# Altium project ESP32_C3_TempHumidity_Monitor.PrjPcb
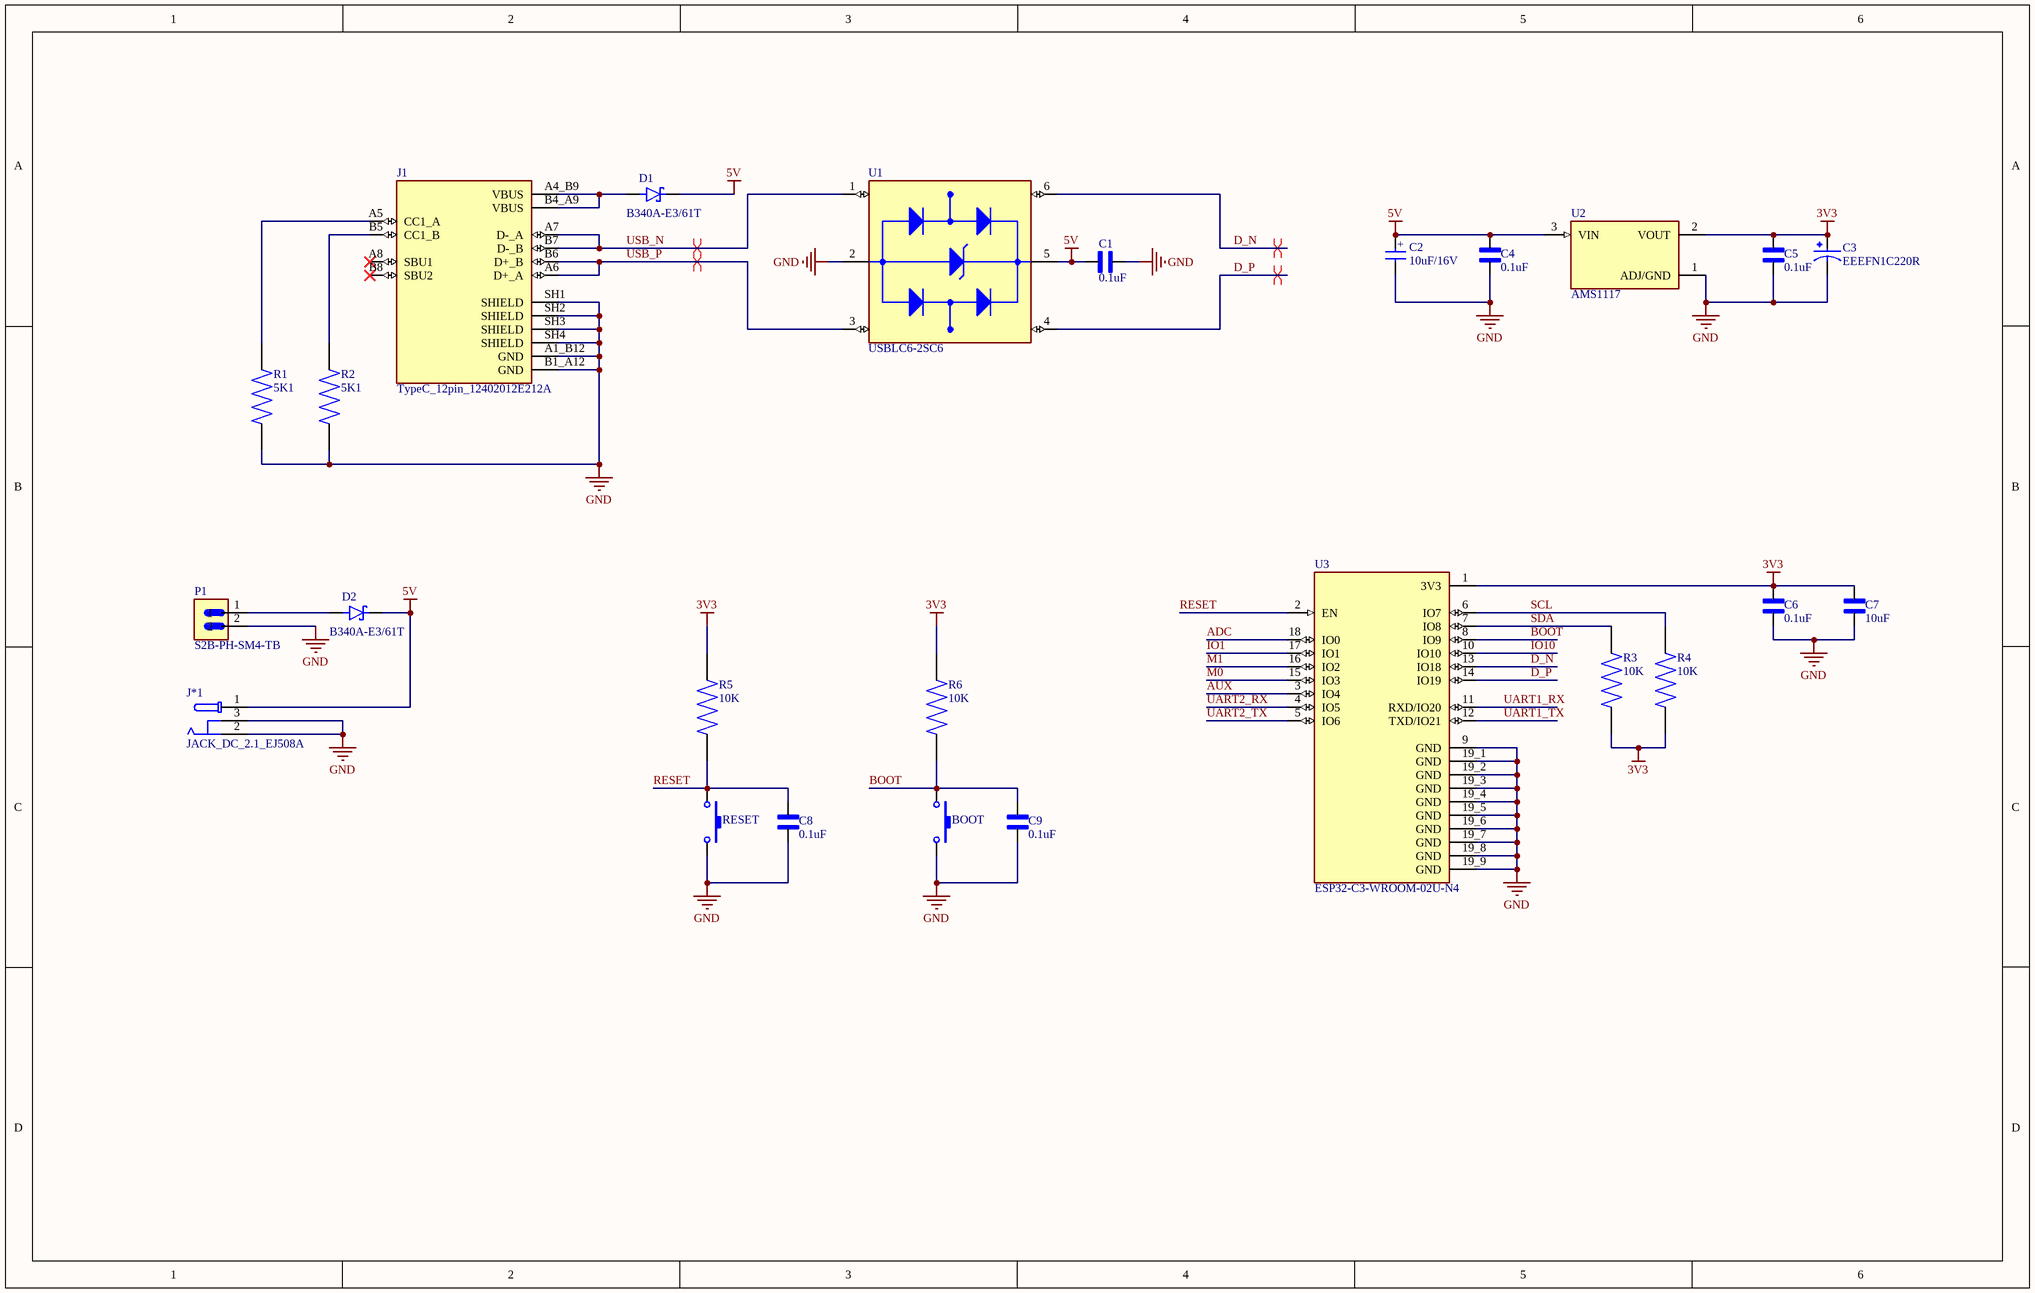
[diagram p0: main.SchDoc]
3 sheets, 50 parts. Net scope: global (net labels, ports and power ports of the same name join across sheets).
Board file: PCB_esp32_c3.PcbDoc
Sheets:
  main.SchDoc
  LoRa.SchDoc
  connect.SchDoc

## Sheet main.SchDoc
size 381 x 241 mm; SheetNumber: 1; SheetTotal: 3

### Parts
BOOT  Nut Nhan 2 Chan SMD 3x6x2.5  [PCBComponent_1]  (value not drawn)
C1  0.1uF  [CAPC1608X94N]
C2  10uF/16V  [WCAP-AS5H_4X5.5(DXL)]
C3  EEEFN1C220R  [CAP_EEEFN1C220R]
C4  0.1uF  [CAPC1608X94N]
C5  0.1uF  [CAPC1608X94N]
C6  0.1uF  [CAPC1608X94N]
C7  10uF  [CAPC1608X94N]
C8  0.1uF  [CAPC1005X61N]
C9  0.1uF  [CAPC1005X61N]
D1  B340A-E3/61T  [DIOM5126X229N]
D2  B340A-E3/61T  [DIOM5126X229N]
J1  TypeC_12pin_12402012E212A  [TypeC_12pin_12402012E212A]
J*1  JACK_DC_2.1_EJ508A  [MPD_EJ508A]
P1  S2B-PH-SM4-TB  [JST_S2B-PH-SM4-TB]
R1  5K1  [RES_ERJU02F5102X]
R2  5K1  [RES_ERJU02F5102X]
R3  10K  [RES_ERJU02F5102X]
R4  10K  [RES_ERJU02F5102X]
R5  10K  [RES_ERJU02F5102X]
R6  10K  [RES_ERJU02F5102X]
RESET  Nut Nhan 2 Chan SMD 3x6x2.5  [PCBComponent_1]  (value not drawn)
U1  USBLC6-2SC6  [USBLC6-2SC6]
U2  AMS1117  [SOT229P700X180-4N]
U3  ESP32-C3-WROOM-02U-N4  [XCVR_ESP32-C3-WROOM-02U-N4]

### Nets
3V3: C3.1 C5.2 C6.2 C7.2 R3.1 R4.1 R5.1 R6.1 U2.2(VOUT) U3.1(3V3)
5V: C1.2 C2.1(POS) C4.2 D1.C D2.C J*1.1 U1.5(VBUS) U2.3(VIN)
GND: BOOT.2 C1.1 C2.2(NEG) C3.2 C4.1 C5.1 C6.1 C7.1 C8.1 C9.1 J1.A1_B12(GND) J1.B1_A12(GND) J1.SH1(SHIELD) J1.SH2(SHIELD) J1.SH3(SHIELD) J1.SH4(SHIELD) J*1.2 J*1.3 P1.2 R1.1 R2.1 RESET.2 U1.2(GND) U2.1(ADJ/GND) U3.9(GND) U3.19_1(GND) U3.19_2(GND) U3.19_3(GND) U3.19_4(GND) U3.19_5(GND) U3.19_6(GND) U3.19_7(GND) U3.19_8(GND) U3.19_9(GND)
ADC: U3.18(IO0)
AUX: U3.3(IO4)
BOOT: BOOT.1 C9.2 R6.2 U3.8(IO9)
D_N: U1.6(I/O1_OUT) U3.13(IO18)
D_P: U1.4(I/O2_OUT) U3.14(IO19)
IO1: U3.17(IO1)
IO10: U3.10(IO10)
M0: U3.15(IO3)
M1: U3.16(IO2)
RESET: C8.2 R5.2 RESET.1 U3.2(EN)
SCL: R4.2 U3.6(IO7)
SDA: R3.2 U3.7(IO8)
UART1_RX: U3.11(RXD/IO20)
UART1_TX: U3.12(TXD/IO21)
UART2_RX: U3.4(IO5)
UART2_TX: U3.5(IO6)
USB_N: J1.A7(D-_A) J1.B7(D-_B) U1.1(I/O1_IN)
USB_P: J1.A6(D+_A) J1.B6(D+_B) U1.3(I/O2_IN)
NetD1_A: D1.A J1.A4_B9(VBUS) J1.B4_A9(VBUS)
NetD2_A: D2.A P1.1
NetJ1_A5: J1.A5(CC1_A) R1.2
NetJ1_B5: J1.B5(CC1_B) R2.2

Not connected (* = marked no-connect by the designer): J1 A8(SBU1)* B8(SBU2)*

### Layout directives
differential pair: D_N, D_P, USB_N, USB_P

### Notes on the sheet
- (in symbol CAP_10uF_25V_WCAP-AS5H_4X5.5) +

### Library data of the parts
BOOT RESET = Nut Nhan 2 Chan SMD 3x6x2.5: Ma_Hang: MH001036; Ten: Nút Nhấn 2 Chân 3x6x2.5MM SMD
C1 C4-C7 = cap_0603_VJ0603D3R9DXCAP: cap 0603 (1608 Metric); MF: Vishay Vitramon; SnapEDA_Link: https://www.snapeda.com/parts/VJ0603D3R9DXCAP/Vishay/view-part/?ref=snap; Package: 1608 Vishay Vitramon; Value: *; MP: VJ0603D3R9DXCAP; Check_prices: https://www.snapeda.com/parts/VJ0603D3R9DXCAP/Vishay/view-part/?ref=eda
C2 = CAP_10uF_25V_WCAP-AS5H_4X5.5: CAP ALUM 10UF 20% 25V SMD; MF: WÃ¼rth Elektronik; MP: 865230440002; SnapEDA_Link: https://www.snapeda.com/parts/865230440002/W%25C3%25BCrth+Elektronik+Midcom/view-part/?ref=snap; Package: Radial WÃ¼rth Elektronik; Value: *; Check_prices: https://www.snapeda.com/parts/865230440002/W%25C3%25BCrth+Elektronik+Midcom/view-part/?ref=eda
C3 = EEEFN1C220R: CAP ALUM 22UF 20% 16V SMD; MF: Panasonic Electronic Components; MP: EEE-FN1C220R; Package: RADIAL-2 Panasonic; Value: *; Price: None; Check_prices: https://www.snapeda.com/parts/EEE-FN1C220R/Panasonic/view-part/6178704/?ref=eda; Purchase-URL: https://pricing.snapeda.com/search/part/EEE-FN1C220R/?ref=eda; Availability: In Stock; SnapEDA_Link: https://www.snapeda.com/parts/EEE-FN1C220R/Panasonic/view-part/6178704/?ref=snap
C8 C9 = cap_0402_VJ0402D100MXCAP: cap 0402; MF: Vishay Vitramon; SnapEDA_Link: https://www.snapeda.com/parts/VJ0402D100MXCAP/Vishay/view-part/?ref=snap; Package: 1005 Vishay Vitramon; Value: *; MP: VJ0402D100MXCAP; Check_prices: https://www.snapeda.com/parts/VJ0402D100MXCAP/Vishay/view-part/?ref=eda
D1 D2 = B340A-E3/61T: Diode Schottky 40 V 3A Surface Mount DO-214AC (SMA); MF: Vishay Semiconductor; SnapEDA_Link: https://www.snapeda.com/parts/B340A-E3/61T/Vishay/view-part/?ref=snap; Package: DO-214 Vishay Semiconductor; Value: *; MP: B340A-E3/61T; Check_prices: https://www.snapeda.com/parts/B340A-E3/61T/Vishay/view-part/?ref=eda
J1 = TypeC_12pin_12402012E212A: USB2.0, Type C, Top mount, CH 1.68mm, Dual Row SMT; MF: Amphenol ICC (Commercial Products); MP: 12402012E212A; Price: None; Package: None; Availability: In Stock; SnapEDA_Link: https://www.snapeda.com/parts/12402012E212A/Amphenol/view-part/?ref=snap; Value: *; Check_prices: https://www.snapeda.com/parts/12402012E212A/Amphenol/view-part/?ref=eda; Purchase-URL: https://pricing.snapeda.com/search/part/12402012E212A/?ref=eda
J*1 = JACK_DC_2.1_EJ508A: Power Barrel Connector Jack 2.10mm ID _0.083_, 5.50mm OD _0.217_ Through Hole, Right Angle / EJ508A; MF: MPD; Package: Non-Standard MPD; Value: *; SnapEDA_Link: https://www.snapeda.com/parts/EJ508A/MPD%20%28Memory%20Protection%20Devices%29/view-part/474399/?ref=snap; Price: None; MP: EJ508A; Availability: Unavailable
P1 = S2B-PH-SM4-TB: Connector Header Surface Mount, Right Angle 2 position 0.079 (2.00mm); MF: JST Sales; SnapEDA_Link: https://www.snapeda.com/parts/S2B-PH-SM4-TB/JST/view-part/?ref=snap; Package: None; Value: *; MP: S2B-PH-SM4-TB; Check_prices: https://www.snapeda.com/parts/S2B-PH-SM4-TB/JST/view-part/?ref=eda
R1-R6 = res_0402_ERJU02F5102X: Availability: Unavailable; MP: ERJU02F5102X; Price: None; Package: None; Value: *
U1 = USBLC6-2SC6: 17V Clamp 5A (8/20Âµs) Ipp Tvs Diode Surface Mount SOT-23-6; MF: STMicroelectronics; Value: *; SnapEDA_Link: https://www.snapeda.com/parts/USBLC6-2SC6/STMicroelectronics/view-part/?ref=snap; Check_prices: https://www.snapeda.com/parts/USBLC6-2SC6/STMicroelectronics/view-part/?ref=eda; Purchase-URL: https://pricing.snapeda.com/search/part/USBLC6-2SC6/?ref=eda; Price: None; Availability: In Stock; Package: SOT-23-6 STMicroelectronics; MP: USBLC6-2SC6
U2 = AMS1117: 1A LOW DROPOUT VOLTAGE REGULATOR SOT-223; MF: Advanced Monolithic Systems; SnapEDA_Link: https://www.snapeda.com/parts/AMS1117/Advanced+Monolithic+Systems/view-part/?ref=snap; Package: SOT-223 Seeed Technology; Value: *; MP: AMS1117; Check_prices: https://www.snapeda.com/parts/AMS1117/Advanced+Monolithic+Systems/view-part/?ref=eda
U3 = ESP32-C3-WROOM-02U-N4: Bluetooth, WiFi 802.11b/g/n, Bluetooth v5.0 Transceiver Module 2.4GHz Antenna Not Included, U.FL Surface Mount; MF: Espressif Systems; SnapEDA_Link: https://www.snapeda.com/parts/ESP32-C3-WROOM-02U-N4/Espressif+Systems/view-part/?ref=snap; Package: SMD-19 Espressif Systems; Value: *; MP: ESP32-C3-WROOM-02U-N4; Check_prices: https://www.snapeda.com/parts/ESP32-C3-WROOM-02U-N4/Espressif+Systems/view-part/?ref=eda

## Sheet LoRa.SchDoc
size A; SheetNumber: 2; SheetTotal: 3
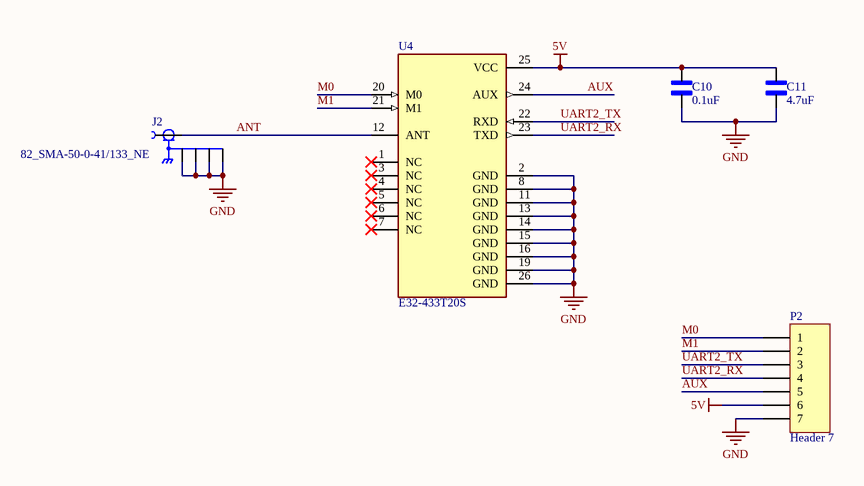
[diagram p1: LoRa.SchDoc]

### Parts
C10  0.1uF  [CAPC1005X61N]
C11  4.7uF  [CAPC1005X61N]
J2  82_SMA-50-0-41/133_NE  [HUBER+SUHNER_82_SMA-50-0-41/133_NE]
P2  Header 7  [HDR1X7]
U4  E32-433T20S  [MODULE_E32-433T20S]

### Nets
5V: C10.2 C11.2 P2.6 U4.25(VCC)
GND: C10.1 C11.1 J2.G1 J2.G2 J2.G3 J2.G4 P2.7 U4.2(GND) U4.8(GND) U4.11(GND) U4.13(GND) U4.14(GND) U4.15(GND) U4.16(GND) U4.19(GND) U4.26(GND)
ANT: J2.1 U4.12(ANT)
AUX: P2.5 U4.24(AUX)
M0: P2.1 U4.20(M0)
M1: P2.2 U4.21(M1)
UART2_RX: P2.4 U4.23(TXD)
UART2_TX: P2.3 U4.22(RXD)

Not connected (* = marked no-connect by the designer): U4 1(NC)* 3(NC)* 4(NC)* 5(NC)* 6(NC)* 7(NC)*

### Library data of the parts
C10 C11 = cap_0402_VJ0402D100MXCAP: cap 0402; MF: Vishay Vitramon; SnapEDA_Link: https://www.snapeda.com/parts/VJ0402D100MXCAP/Vishay/view-part/?ref=snap; Package: 1005 Vishay Vitramon; Value: *; MP: VJ0402D100MXCAP; Check_prices: https://www.snapeda.com/parts/VJ0402D100MXCAP/Vishay/view-part/?ref=eda
J2 = 82_SMA-50-0-41/133_NE: RF Connectors / Coaxial Connectors, Straight Pcb Jack | HUBER+SUHNER 82_SMA-50-0-41/133_NE; SnapEDA_Link: https://www.snapeda.com/parts/82_SMA-50-0-41/133_NE/Huber%252BSuhner/view-part/?ref=snap; Package: None; Value: *; MF: HUBER+SUHNER; MP: 82_SMA-50-0-41/133_NE; Check_prices: https://www.snapeda.com/parts/82_SMA-50-0-41/133_NE/Huber%252BSuhner/view-part/?ref=eda
P2 = Header 7: Header, 7-Pin; LatestRevisionDate: 17-Jul-2002; LatestRevisionNote: Re-released for DXP Platform.; Publisher: Altium Limited
U4 = E32-433T20S: Wireless serial port module (UART); MF: EBYTE; Check_prices: https://www.snapeda.com/parts/E32-433T20S/EBYTE/view-part/?ref=eda; Package: Package; MP: E32-433T20S; Value: *; SnapEDA_Link: https://www.snapeda.com/parts/E32-433T20S/EBYTE/view-part/?ref=snap; Price: None; Availability: Not in stock

## Sheet connect.SchDoc
size B; SheetNumber: 3; SheetTotal: 3
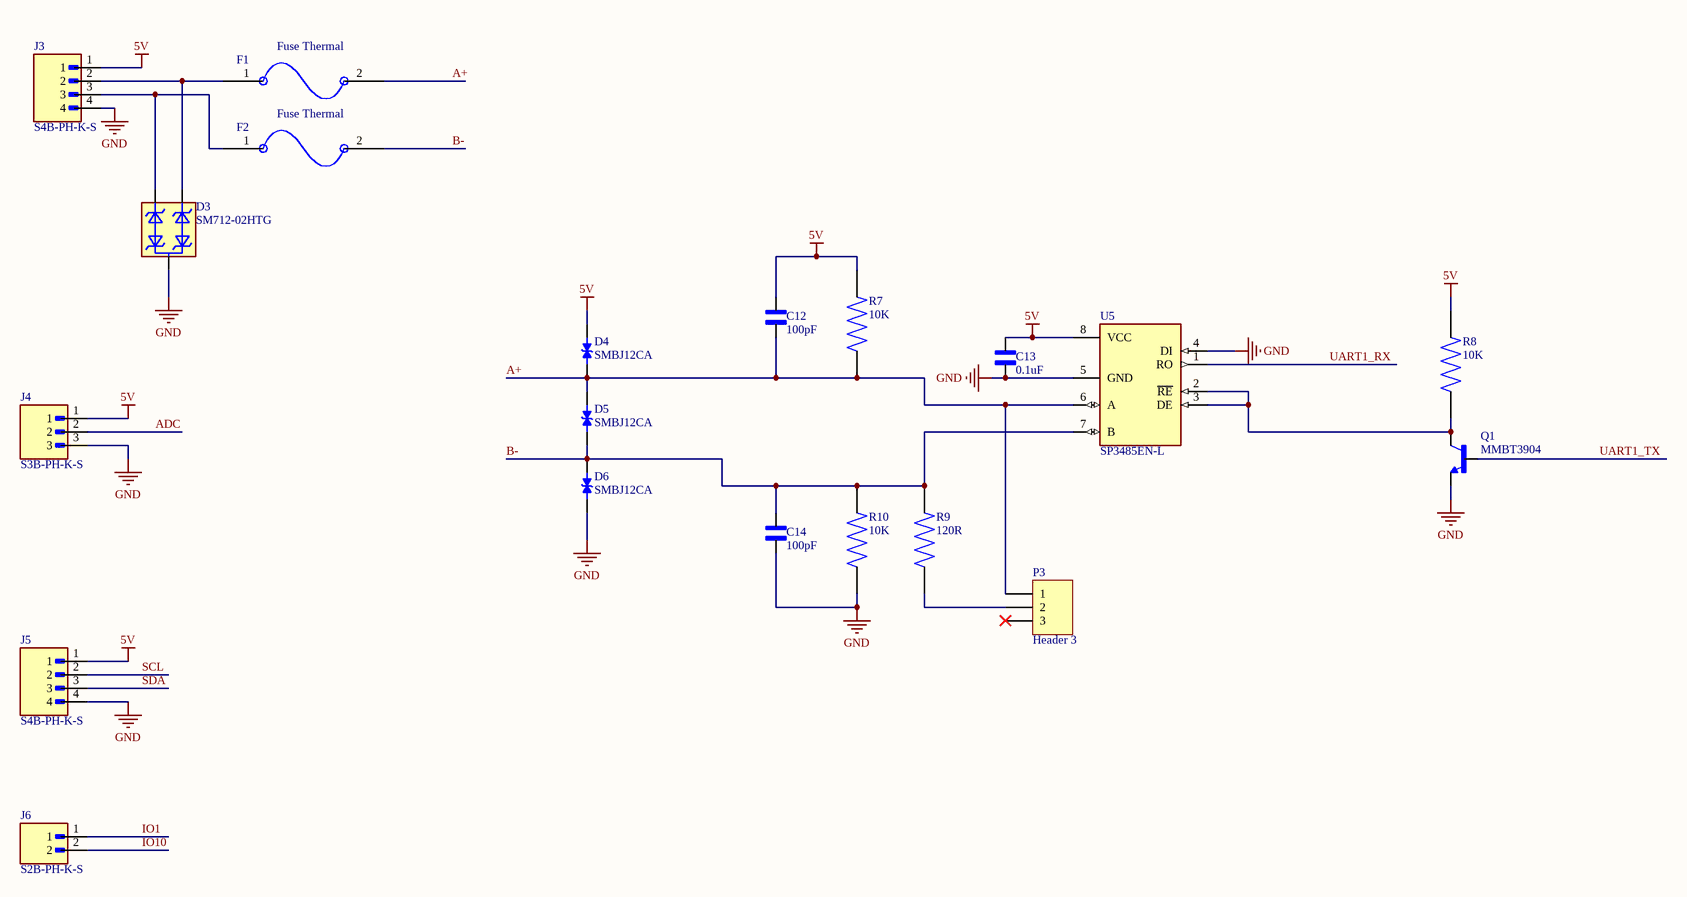
[diagram p2: connect.SchDoc]

### Parts
C12  100pF  [CAPC1005X61N]
C13  0.1uF  [CAPC1005X61N]
C14  100pF  [CAPC1005X61N]
D3  SM712-02HTG  [SOT23]
D4  SMBJ12CA  [DIOM4336X265N]
D5  SMBJ12CA  [DIOM4336X265N]
D6  SMBJ12CA  [DIOM4336X265N]
F1  Fuse Thermal  [RES_ERJU08J224V]
F2  Fuse Thermal  [RES_ERJU08J224V]
J3  S4B-PH-K-S  [JST_S4B-PH-K-S]
J4  S3B-PH-K-S  [JST_S3B-PH-K-S]
J5  S4B-PH-K-S  [JST_S4B-PH-K-S]
J6  S2B-PH-K-S  [JST_S2B-PH-K-S]
P3  Header 3  [HDR1X3]
Q1  MMBT3904  [TRANS_MMBT3904]
R7  10K  [RES_ERJU02F5102X]
R8  10K  [RES_ERJU02F5102X]
R9  120R  [RES_ERJU02F5102X]
R10  10K  [RES_ERJU02F5102X]
U5  SP3485EN-L  [SOIC127P599X175-8N]

### Nets
5V: C12.2 C13.2 D4.2 J3.1 J4.1 J5.1 R7.1 R8.1 U5.8(VCC)
GND: C13.1 C14.1 D3.3 D6.1 J3.4 J4.3 J5.4 Q1.2(E) R10.2 U5.4(DI) U5.5(GND)
A+: C12.1 D4.1 D5.2 F1.2 P3.1 R7.2 U5.6(A)
ADC: J4.2
B-: C14.2 D5.1 D6.2 F2.2 R9.1 R10.1 U5.7(B)
IO1: J6.1
IO10: J6.2
SCL: J5.2
SDA: J5.3
UART1_RX: U5.1(RO)
UART1_TX: Q1.1(B)
NetD3_1: D3.1 F1.1 J3.2
NetD3_2: D3.2 F2.1 J3.3
NetP3_2: P3.2 R9.2
NetQ1_3: Q1.3(C) R8.2 U5.2(~{RE}) U5.3(DE)

Not connected (* = marked no-connect by the designer): P3 3*

### Library data of the parts
C12-C14 = cap_0402_VJ0402D100MXCAP: cap 0402; MF: Vishay Vitramon; SnapEDA_Link: https://www.snapeda.com/parts/VJ0402D100MXCAP/Vishay/view-part/?ref=snap; Package: 1005 Vishay Vitramon; Value: *; MP: VJ0402D100MXCAP; Check_prices: https://www.snapeda.com/parts/VJ0402D100MXCAP/Vishay/view-part/?ref=eda
D3 = SM712-02HTG: TVS Diode, SM712 Series, 31V Clamp, 600W Peak Pulse, Surface Mount, SOT23-3 | Littelfuse SM712-02HTG; MF: Littelfuse Inc.; SnapEDA_Link: https://www.snapeda.com/parts/SM712-02HTG/Littelfuse/view-part/?ref=snap; Package: SOT-23 Littelfuse Inc.; Value: *; MP: SM712-02HTG; Check_prices: https://www.snapeda.com/parts/SM712-02HTG/Littelfuse/view-part/?ref=eda
D4-D6 = SMBJ10CA-13-F: MF: {'manufacturer': u'Diodes Incorporated'}; Package: None; Price: None; Value: *; MP: SMBJ10CA-13-F; Availability: Unavailable
F1 F2 = Fuse Thermal: Fuse, Resettable, Fast Acting, 10A, Sz 1206, 0.134x0.071x0.033", SMT, 24VDC, PCB | Bourns MF-NSMF200-2
J3 J5 = S4B-PH-K-S: Connector Header Through Hole, Right Angle 4 position 0.079 (2.00mm); MF: JST Sales; SnapEDA_Link: https://www.snapeda.com/parts/S4B-PH-K-S/JST/view-part/?ref=snap; Package: NON STANDARD-4 J.S.T.; Value: *; MP: S4B-PH-K-S; Check_prices: https://www.snapeda.com/parts/S4B-PH-K-S/JST/view-part/?ref=eda
J4 = S3B-PH-K-S: Connector Header Through Hole, Right Angle 3 position 0.079 (2.00mm); MF: JST Sales; SnapEDA_Link: https://www.snapeda.com/parts/S3B-PH-K-S/JST/view-part/?ref=snap; Package: NON STANDARD-3 J.S.T.; Value: *; MP: S3B-PH-K-S; Check_prices: https://www.snapeda.com/parts/S3B-PH-K-S/JST/view-part/?ref=eda
J6 = S2B-PH-K-S: Connector Header Through Hole, Right Angle 2 position 0.079 (2.00mm); MF: JST Sales; SnapEDA_Link: https://www.snapeda.com/parts/S2B-PH-K-S/JST/view-part/?ref=snap; Package: NON STANDARD-2 J.S.T.; Value: *; MP: S2B-PH-K-S; Check_prices: https://www.snapeda.com/parts/S2B-PH-K-S/JST/view-part/?ref=eda
P3 = Header 3: Header, 3-Pin; LatestRevisionDate: 17-Jul-2002; LatestRevisionNote: Re-released for DXP Platform.; Publisher: Altium Limited
Q1 = MMBT3904: BJT, SOT-23, 40V, 200mA, NPN, 0.35W, 150Â°C; MF: Diotec Semiconductor; SnapEDA_Link: https://www.snapeda.com/parts/MMBT3904/Diotec/view-part/?ref=snap; Package: SOT-23 Diotec; Value: *; MP: MMBT3904; Check_prices: https://www.snapeda.com/parts/MMBT3904/Diotec/view-part/?ref=eda
R7-R10 = res_0402_ERJU02F5102X: Availability: Unavailable; MP: ERJU02F5102X; Price: None; Package: None; Value: *
U5 = SP3485EN-L: 1/1 Transceiver Half RS422, RS485 8-SOIC; MF: MaxLinear, Inc.; SnapEDA_Link: https://www.snapeda.com/parts/SP3485EN-L/MaxLinear/view-part/?ref=snap; Package: None; Value: *; MP: SP3485EN-L; Check_prices: https://www.snapeda.com/parts/SP3485EN-L/MaxLinear/view-part/?ref=eda

## Nets that join several sheets
5V: main (8 pins), LoRa (C10.2 C11.2 P2.6 U4.25), connect (9 pins)
GND: main (34 pins), LoRa (16 pins), connect (11 pins)
ADC: main (U3.18), connect (J4.2)
AUX: main (U3.3), LoRa (P2.5 U4.24)
IO1: main (U3.17), connect (J6.1)
IO10: main (U3.10), connect (J6.2)
M0: main (U3.15), LoRa (P2.1 U4.20)
M1: main (U3.16), LoRa (P2.2 U4.21)
SCL: main (R4.2 U3.6), connect (J5.2)
SDA: main (R3.2 U3.7), connect (J5.3)
UART1_RX: main (U3.11), connect (U5.1)
UART1_TX: main (U3.12), connect (Q1.1)
UART2_RX: main (U3.4), LoRa (P2.4 U4.23)
UART2_TX: main (U3.5), LoRa (P2.3 U4.22)